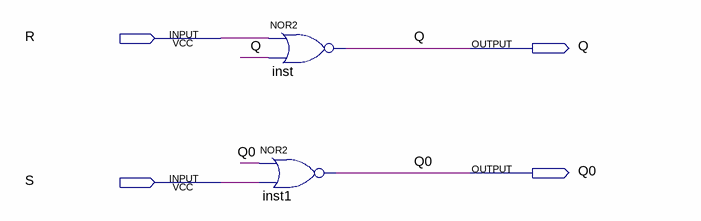
[diagram p0: schematic sheet]
// Quartus schematic FPGA_SR_Latch.bdf as structural Verilog: 2 symbols, 4 pins
module FPGA_SR_Latch (
  input  R,
  input  S,
  output Q,
  output Q0
);

  nor inst (Q, R, Q);
  nor inst1 (Q0, Q0, S);
endmodule
